# Altium schematic sheet Air780EHT.schdoc
size 363 x 111 mm
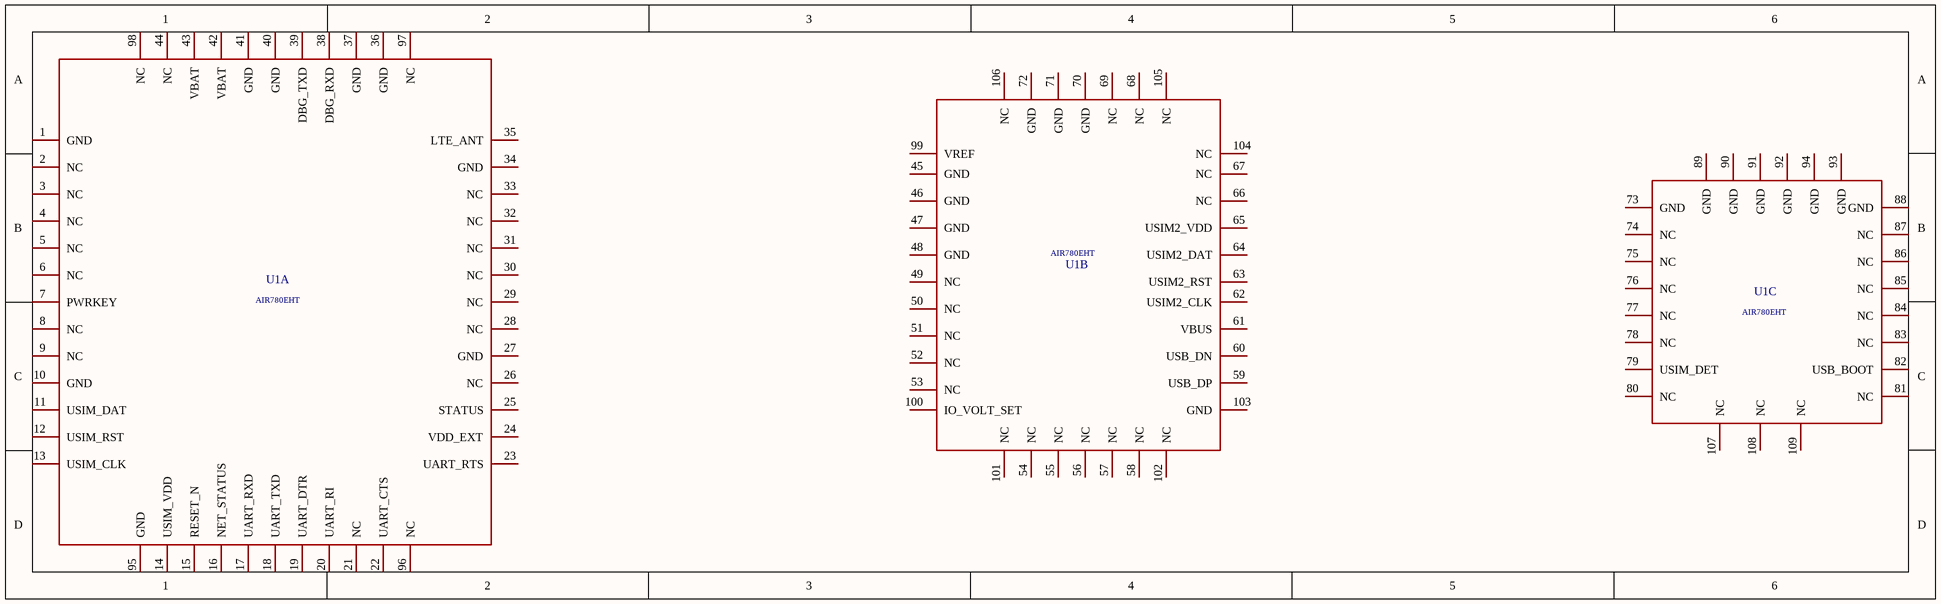
[diagram p0: Air780EHT.schdoc]

## Parts
U1  Air780EHT  (parts A,B,C of 3)

## Nets

Not connected (* = marked no-connect by the designer): U1 1(GND) 2(NC) 3(NC) 4(NC) 5(NC) 6(NC) 7(PWRKEY) 8(NC) 9(NC) 10(GND) 11(USIM_DAT) 12(USIM_RST) 13(USIM_CLK) 14(USIM_VDD) 15(RESET_N) 16(NET_STATUS) 17(UART_RXD) 18(UART_TXD) 19(UART_DTR) 20(UART_RI) 21(NC) 22(UART_CTS) 23(UART_RTS) 24(VDD_EXT) 25(STATUS) 26(NC) 27(GND) 28(NC) 29(NC) 30(NC) 31(NC) 32(NC) 33(NC) 34(GND) 35(LTE_ANT) 36(GND) 37(GND) 38(DBG_RXD) 39(DBG_TXD) 40(GND) 41(GND) 42(VBAT) 43(VBAT) 44(NC) 45(GND) 46(GND) 47(GND) 48(GND) 49(NC) 50(NC) 51(NC) 52(NC) 53(NC) 54(NC) 55(NC) 56(NC) 57(NC) 58(NC) 59(USB_DP) 60(USB_DN) 61(VBUS) 62(USIM2_CLK) 63(USIM2_RST) 64(USIM2_DAT) 65(USIM2_VDD) 66(NC) 67(NC) 68(NC) 69(NC) 70(GND) 71(GND) 72(GND) 73(GND) 74(NC) 75(NC) 76(NC) 77(NC) 78(NC) 79(USIM_DET) 80(NC) 81(NC) 82(USB_BOOT) 83(NC) 84(NC) 85(NC) 86(NC) 87(NC) 88(GND) 89(GND) 90(GND) 91(GND) 92(GND) 93(GND) 94(GND) 95(GND) 96(NC) 97(NC) 98(NC) 99(VREF) 100(IO_VOLT_SET) 101(NC) 102(NC) 103(GND) 104(NC) 105(NC) 106(NC) 107(NC) 108(NC) 109(NC)

## Library data of the parts
U1 = AIR780EHT: Add into BOM: yes; Symbol: AIR780EHT; Device: AIR780EHT; PART-TYPE: AIR780EHT; Convert to PCB: yes; Origin Footprint: AIR780E